# Altium schematic sheet Power_Management.SchDoc
size A; SheetNumber: 5; SheetTotal: 7
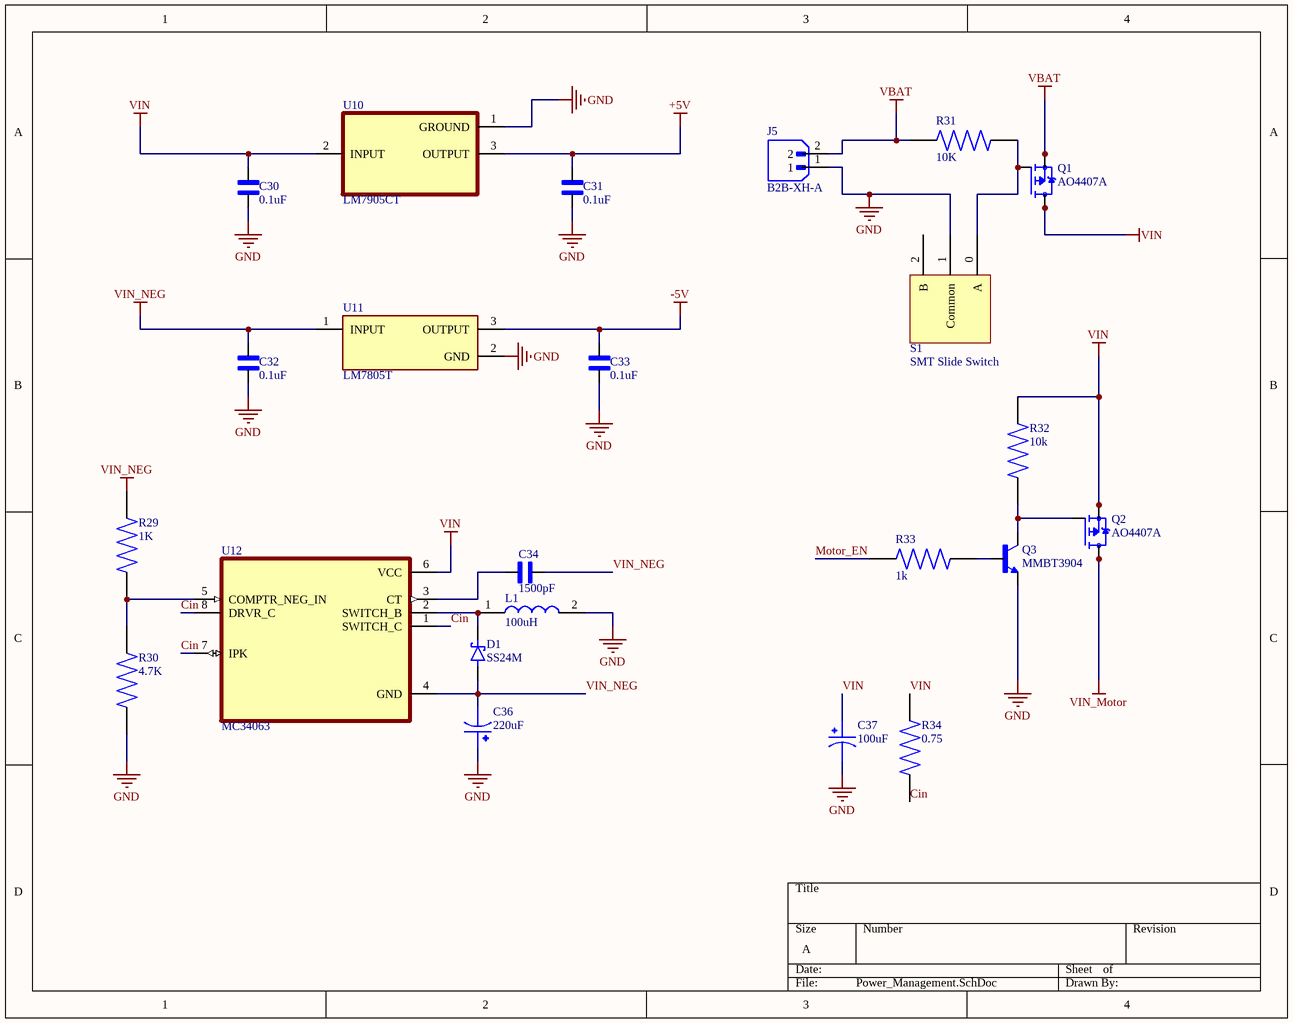
[diagram p0: Power_Management.SchDoc]

## Parts
C30  0.1uF  [CAPC2012X140N]
C31  0.1uF  [CAPC2012X140N]
C32  0.1uF  [CAPC2012X140N]
C33  0.1uF  [CAPC2012X140N]
C34  1500pF  [CAPC2012X145N]
C36  220uF  [CAPAE1030X1080N_UWT1H221MNL1GS]
C37  100uF  [CAPAE1030X1080N_UWT1H221MNL1GS]
D1  SS24M  [SODFL2512X73N]
J5  B2B-XH-A  [JST_B2B-XH-A]
L1  100uH  [INDPM125125X800N]
Q1  AO4407A  [SOIC127P600X175-8N]
Q2  AO4407A  [SOIC127P600X175-8N]
Q3  MMBT3904  [TRANS_MMBT3904]
R29  1K  [RES_ERJU06F1001V]
R30  4.7K  [RES_ERJU06F1001V]
R31  10K  [RESC2012X55N]
R32  10k  [RESC2012X55N]
R33  1k  [RES_ERJU06F1001V]
R34  0.75  [RES_ERJ6BQJR75V]
S1  SMT Slide Switch  [PCBComponent_1]
U10  LM7905CT  [TO254P1054X470X1955-3]
U11  LM7805T  [TO254P1011X457X1950-3]
U12  MC34063  [SOIC127P599X175-8N]

## Nets
+5V: C31.2 U10.3(OUTPUT)
-5V: C33.2 U11.3(OUTPUT)
GND: C30.1 C31.1 C32.1 C33.1 C36.1 C37.2 J5.1 L1.2 Q3.2(E) R30.1 S1.1(Common) U10.1(GROUND) U11.2(GND)
VBAT: J5.2 Q1.1(S) Q1.2(S) Q1.3(S) R31.1
VIN: C30.2 C37.1 Q1.5(D) Q1.6(D) Q1.7(D) Q1.8(D) Q2.1(S) Q2.2(S) Q2.3(S) R32.2 R34.2 U10.2(INPUT) U12.6(VCC)
VIN_Motor: Q2.5(D) Q2.6(D) Q2.7(D) Q2.8(D)
VIN_NEG: C32.2 C34.2 C36.2 D1.A R29.2 U11.1(INPUT) U12.4(GND)
Cin: R34.1 U12.1(SWITCH_C) U12.7(IPK) U12.8(DRVR_C)
Motor_EN: R33.1
NetC34_1: C34.1 U12.3(CT)
NetD1_C: D1.C(K) L1.1 U12.2(SWITCH_B)
NetQ1_4: Q1.4(G) R31.2 S1.0(A)
NetQ2_4: Q2.4(G) Q3.3(C) R32.1
NetQ3_1: Q3.1(B) R33.2
NetR29_1: R29.1 R30.2 U12.5(COMPTR_NEG_IN)

Not connected (* = marked no-connect by the designer): S1 2(B)

## Library data of the parts
C30-C33 = FS055C104K4Z2A: 0.1 ÂµF Â±10% 50V Ceramic Capacitor X7R 0805 (2012 Metric); MF: AVX; SnapEDA_Link: https://www.snapeda.com/parts/FS055C104K4Z2A/AVX/view-part/?ref=snap; Package: 0805-2 AVX; Value: *; MP: FS055C104K4Z2A; Check_prices: https://www.snapeda.com/parts/FS055C104K4Z2A/AVX/view-part/?ref=eda
C34 = VJ0805A152JXAAC: 1500 pF Â±5% 50V Ceramic Capacitor C0G, NP0 0805 (2012 Metric); MF: Vishay Vitramon; SnapEDA_Link: https://www.snapeda.com/parts/VJ0805A152JXAAC/Vishay/view-part/?ref=snap; Package: 2012 Vishay Vitramon; Value: *; MP: VJ0805A152JXAAC; Check_prices: https://www.snapeda.com/parts/VJ0805A152JXAAC/Vishay/view-part/?ref=eda
C36 C37 = UWT1H221MNL1GS: 220ÂµF 50V Aluminum Electrolytic Capacitors Radial, Can - SMD 1000 Hrs @ 105Â°C; MF: Nichicon; Package: Radial Nichicon; Price: None; Availability: Unavailable; MP: UWT1H221MNL1GS; SnapEDA_Link: https://www.snapeda.com/parts/UWT1H221MNL1GS/Nichicon/view-part/566503/?ref=snap; Value: *
J5 = B2B-XH-A: MF: {'manufacturer': u'JST Sales America Inc.'}; Package: None; Price: None; Value: *; MP: B2B-XH-A; Availability: Unavailable
L1 = SRR1280-101M: 100ÂµH Shielded Wirewound Inductor 2.1A 150mOhm Max Nonstandard; MF: Bourns; Purchase-URL: https://pricing.snapeda.com/search/part/SRR1280-101M/?ref=eda; Price: None; SnapEDA_Link: https://www.snapeda.com/parts/SRR1280-101M/Bourns%20-%20J.W.%20Miller/view-part/289867/?ref=snap; MP: SRR1280-101M; Availability: Good; Value: *; Check_prices: https://www.snapeda.com/parts/SRR1280-101M/Bourns%20-%20J.W.%20Miller/view-part/289867/?ref=eda; Package: Nonstandard Bourns
Q1 Q2 = AO4407A: P-Channel 30 V 12A (Ta) 3.1W (Ta) Surface Mount 8-SOIC; MF: Alpha &; SnapEDA_Link: https://www.snapeda.com/parts/AO4407A/Alpha/view-part/?ref=snap; Package: SOIC-8 Alpha &amp; Omega Semiconductor; Value: *; MP: AO4407A; Check_prices: https://www.snapeda.com/parts/AO4407A/Alpha/view-part/?ref=eda
Q3 = MMBT3904: BJT, SOT-23, 40V, 200mA, NPN, 0.35W, 150Â°C; MF: Diotec Semiconductor; SnapEDA_Link: https://www.snapeda.com/parts/MMBT3904/Diotec/view-part/?ref=snap; Package: SOT-23 Diotec; Value: *; MP: MMBT3904; Check_prices: https://www.snapeda.com/parts/MMBT3904/Diotec/view-part/?ref=eda
R29 R30 R33 = ERJU06F1001V: Res Thick Film 0805 1K Ohm 1% 0.125W(1/8W) Â±100ppm/C Sulfur Resistant Pad SMD Automotive T/R; MF: Panasonic; Availability: No availability data; Value: *; Check_prices: https://www.snapeda.com/parts/ERJU06F1001V/Panasonic/view-part/5742057/?ref=eda; Package: 2012-2 Panasonic; SnapEDA_Link: https://www.snapeda.com/parts/ERJU06F1001V/Panasonic/view-part/5742057/?ref=snap; Price: None; MP: ERJU06F1001V
R31 R32 = MCU08050C1002FPW00: Res Thin Film 0805 10K Ohm 1% 0.125W(1/8W) Â±50ppm/Â°C Sulfur Resistant Pad SMD Automotive Medical T/R; MF: Vishay; SnapEDA_Link: https://www.snapeda.com/parts/MCU08050C1002FPW00/Vishay/view-part/?ref=snap; Package: 2012 Vishay; Value: *; MP: MCU08050C1002FPW00; Check_prices: https://www.snapeda.com/parts/MCU08050C1002FPW00/Vishay/view-part/?ref=eda
R34 = ERJ6BQJR75V: Value: *; MP: ERJ6BQJR75V; Availability: Unavailable; Price: None; Package: None
U10 = LM7905CT: 1.5-A, negative linear voltage regulator 3-TO-220 0 to 125; MF: Texas Instruments; SnapEDA_Link: https://www.snapeda.com/parts/LM7905CT/Texas+Instruments/view-part/?ref=snap; Package: TO-220-3 Texas Instruments; Value: *; MP: LM7905CT; Check_prices: https://www.snapeda.com/parts/LM7905CT/Texas+Instruments/view-part/?ref=eda
U11 = LM7805T: 3-Terminal 1.5A Positive Fixed Voltage Regulator; MF: TAEJIN; SnapEDA_Link: https://www.snapeda.com/parts/LM7805T/TAEJIN/view-part/?ref=snap; Package: TO-220-3 TAEJIN; Value: *; MP: LM7805T; Check_prices: https://www.snapeda.com/parts/LM7805T/TAEJIN/view-part/?ref=eda
U12 = MC34063ADR2G: Buck, Boost Switching Regulator IC Positive or Negative Adjustable 1.25V 1 Output 1.5A (Switch) 8-SOIC (0.154, 3.90mm Width); MF: ON Semiconductor; SnapEDA_Link: https://www.snapeda.com/parts/MC34063ADR2G/Onsemi/view-part/?ref=snap; Package: SOIC-8 ON Semiconductor; Value: *; MP: MC34063ADR2G; Check_prices: https://www.snapeda.com/parts/MC34063ADR2G/Onsemi/view-part/?ref=eda
D1 = SS24M: Value: *; MP: SS24M; Package: None; Price: None; Availability: Unavailable